# Altium schematic sheet THP_Sensor.SchDoc
size A; SheetNumber: 7; SheetTotal: 9
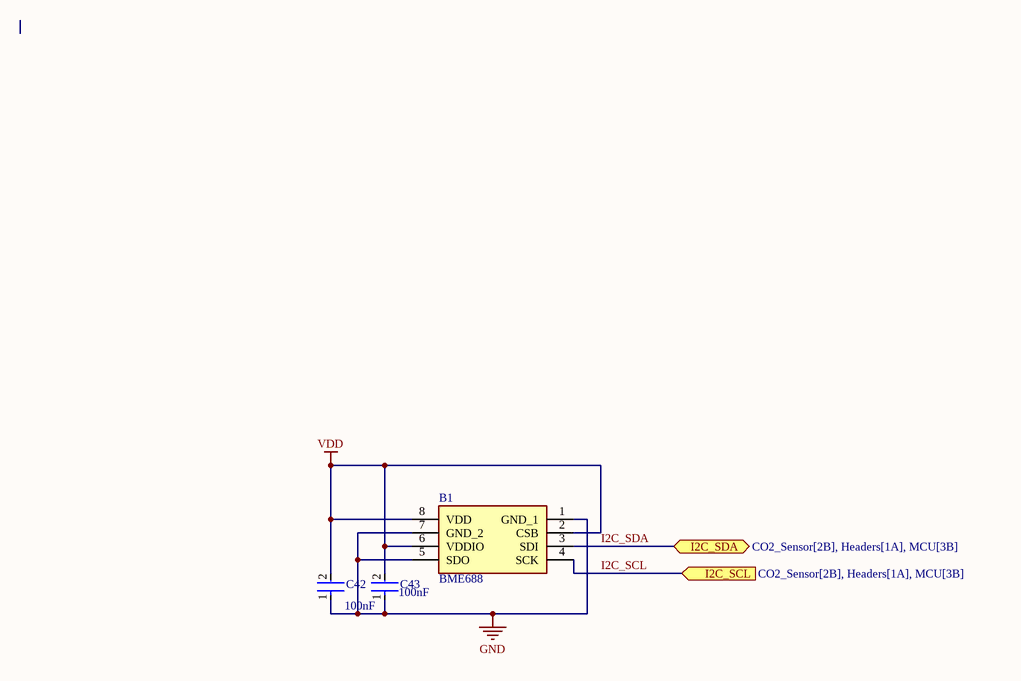
[diagram p0: THP_Sensor.SchDoc]

## Parts
B1  BME688  [BME688]
C42  capacitor: 100nF  [CAP-0402]  (hidden comment: CAP 0402)
C43  capacitor: 100nF  [CAP-0402]  (hidden comment: CAP 0402)

## Ports
I2C_SCL (in, see CO2_Sensor[2B], Headers[1A], MCU[3B]), I2C_SDA (bidir, see CO2_Sensor[2B], Headers[1A], MCU[3B])

## Nets
GND: B1.1(GND_1) B1.5(SDO) B1.7(GND_2) C42.1 C43.1
VDD: B1.2(CSB) B1.6(VDDIO) B1.8(VDD) C42.2 C43.2
I2C_SCL: B1.4(SCK) ; port I2C_SCL
I2C_SDA: B1.3(SDI) ; port I2C_SDA

## Library data of the parts
B1 = BME688: Gas sensor measuring relative humidity, barometric pressure, ambient temperature and gas (VOC); Manufacturer_Name: BOSCH; Geometry.Height: 1mm; Manufacturer_Part_Number: BME688; Mouser Part Number: 262-BME688; Mouser Price/Stock: https://www.mouser.co.uk/ProductDetail/Bosch-Sensortec/BME688?qs=IS%252B4QmGtzzqQoVDscqwx3A%3D%3D; Arrow Part Number: BME688; Arrow Price/Stock: https://www.arrow.com/en/products/bme688/bosch-sensortec.html?utm_currency=USD&region=nac; Datasheet Link: https://www.bosch-sensortec.com/media/boschsensortec/downloads/datasheets/bst-bme688-ds000.pdf
C42 C43 = CAP 0402: Voltage Rating: V
  C42: Parameter 1: *